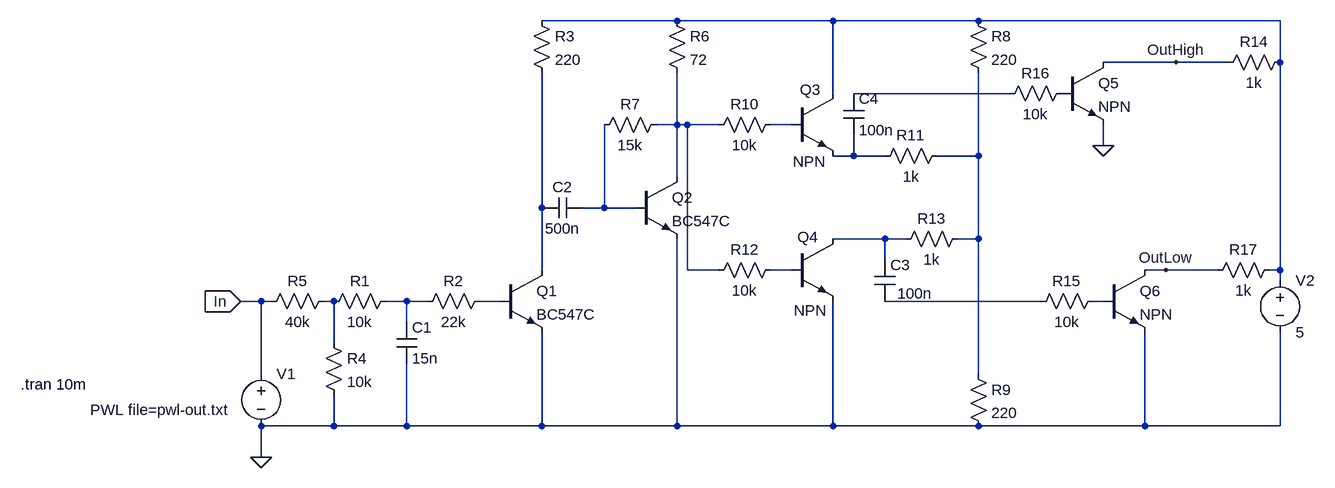
[diagram p0: schematic Filter_incl_Pegelconv_final.asc]
Filter_incl_Pegelconv_final.asc, the LTspice schematic file:
Version 4
SHEET 1 1720 680
WIRE 736 -896 528 -896
WIRE 976 -896 736 -896
WIRE 1200 -896 976 -896
WIRE 1664 -896 1200 -896
WIRE 1504 -832 1392 -832
WIRE 1584 -832 1504 -832
WIRE 1664 -832 1664 -896
WIRE 976 -784 976 -896
WIRE 1248 -784 1008 -784
WIRE 736 -736 736 -816
WIRE 736 -736 704 -736
WIRE 752 -736 736 -736
WIRE 800 -736 752 -736
WIRE 912 -736 880 -736
WIRE 1392 -704 1392 -736
WIRE 1008 -688 1008 -720
WIRE 1008 -688 976 -688
WIRE 1056 -688 1008 -688
WIRE 1200 -688 1200 -816
WIRE 1200 -688 1136 -688
WIRE 736 -656 736 -736
WIRE 528 -608 528 -816
WIRE 624 -608 624 -736
WIRE 624 -608 592 -608
WIRE 672 -608 624 -608
WIRE 1056 -560 976 -560
WIRE 1088 -560 1056 -560
WIRE 1200 -560 1200 -688
WIRE 1200 -560 1168 -560
WIRE 1056 -528 1056 -560
WIRE 528 -512 528 -608
WIRE 752 -512 752 -736
WIRE 800 -512 752 -512
WIRE 912 -512 880 -512
WIRE 1488 -512 1456 -512
WIRE 1568 -512 1488 -512
WIRE 1664 -512 1664 -832
WIRE 1664 -512 1648 -512
WIRE 1664 -496 1664 -512
WIRE 96 -464 64 -464
WIRE 112 -464 96 -464
WIRE 208 -464 192 -464
WIRE 320 -464 288 -464
WIRE 352 -464 320 -464
WIRE 464 -464 432 -464
WIRE 1296 -464 1056 -464
WIRE 1392 -464 1376 -464
WIRE 320 -432 320 -464
WIRE 208 -400 208 -464
WIRE 96 -352 96 -464
WIRE 1200 -352 1200 -560
WIRE 208 -272 208 -320
WIRE 208 -272 96 -272
WIRE 320 -272 320 -368
WIRE 320 -272 208 -272
WIRE 528 -272 528 -416
WIRE 528 -272 320 -272
WIRE 736 -272 736 -560
WIRE 736 -272 528 -272
WIRE 976 -272 976 -464
WIRE 976 -272 736 -272
WIRE 1200 -272 976 -272
WIRE 1456 -272 1456 -416
WIRE 1456 -272 1200 -272
WIRE 1664 -272 1664 -416
WIRE 1664 -272 1456 -272
WIRE 96 -224 96 -272
FLAG 96 -224 0
FLAG 64 -464 In
IOPIN 64 -464 In
FLAG 1488 -512 OutLow
FLAG 1392 -704 0
FLAG 1504 -832 OutHigh
SYMBOL voltage 96 -368 R0
WINDOW 3 -263 71 Left 2
WINDOW 123 24 44 Left 2
WINDOW 39 24 44 Left 2
SYMATTR InstName V1
SYMATTR Value PWL file=pwl-out.txt
SYMBOL res 304 -480 R90
WINDOW 0 0 56 VBottom 2
WINDOW 3 32 56 VTop 2
SYMATTR InstName R1
SYMATTR Value 10k
SYMATTR SpiceLine tol=5
SYMBOL cap 304 -432 R0
SYMATTR InstName C1
SYMATTR Value 15n
SYMATTR SpiceLine V=25 Irms=728m Rser=0.14361 Lser=0
SYMBOL res 448 -480 R90
WINDOW 0 0 56 VBottom 2
WINDOW 3 32 56 VTop 2
SYMATTR InstName R2
SYMATTR Value 22k
SYMBOL voltage 1664 -512 R0
WINDOW 123 0 0 Left 0
WINDOW 39 0 0 Left 0
SYMATTR InstName V2
SYMATTR Value 5
SYMBOL res 512 -912 R0
SYMATTR InstName R3
SYMATTR Value 220
SYMBOL npn 464 -512 R0
SYMATTR InstName Q1
SYMATTR Value BC547C
SYMBOL res 192 -416 R0
SYMATTR InstName R4
SYMATTR Value 10k
SYMBOL res 208 -480 R90
WINDOW 0 0 56 VBottom 2
WINDOW 3 32 56 VTop 2
SYMATTR InstName R5
SYMATTR Value 40k
SYMBOL cap 592 -624 R90
WINDOW 0 0 32 VBottom 2
WINDOW 3 32 32 VTop 2
SYMATTR InstName C2
SYMATTR Value 500n
SYMBOL npn 672 -656 R0
SYMATTR InstName Q2
SYMATTR Value BC547C
SYMBOL res 720 -912 R0
SYMATTR InstName R6
SYMATTR Value 72
SYMBOL res 720 -752 R90
WINDOW 0 0 56 VBottom 2
WINDOW 3 32 56 VTop 2
SYMATTR InstName R7
SYMATTR Value 15k
SYMBOL res 1184 -912 R0
SYMATTR InstName R8
SYMATTR Value 220
SYMBOL res 1184 -368 R0
SYMATTR InstName R9
SYMATTR Value 220
SYMBOL npn 912 -560 R0
WINDOW 0 9 -3 Left 2
WINDOW 3 4 110 Left 2
SYMATTR InstName Q4
SYMBOL res 896 -528 R90
WINDOW 0 0 56 VBottom 2
WINDOW 3 32 56 VTop 2
SYMATTR InstName R12
SYMATTR Value 10k
SYMBOL res 1184 -576 R90
WINDOW 0 0 56 VBottom 2
WINDOW 3 32 56 VTop 2
SYMATTR InstName R13
SYMATTR Value 1k
SYMBOL npn 912 -784 R0
WINDOW 0 13 -6 Left 2
WINDOW 3 2 105 Left 2
SYMATTR InstName Q3
SYMBOL res 896 -752 R90
WINDOW 0 0 56 VBottom 2
WINDOW 3 32 56 VTop 2
SYMATTR InstName R10
SYMATTR Value 10k
SYMBOL npn 1392 -512 R0
SYMATTR InstName Q6
SYMBOL res 1392 -480 R90
WINDOW 0 0 56 VBottom 2
WINDOW 3 32 56 VTop 2
SYMATTR InstName R15
SYMATTR Value 10k
SYMBOL res 1664 -528 R90
WINDOW 0 0 56 VBottom 2
WINDOW 3 32 56 VTop 2
SYMATTR InstName R17
SYMATTR Value 1k
SYMBOL res 1152 -704 R90
WINDOW 0 0 56 VBottom 2
WINDOW 3 32 56 VTop 2
SYMATTR InstName R11
SYMATTR Value 1k
SYMBOL res 1680 -848 R90
WINDOW 0 0 56 VBottom 2
WINDOW 3 32 56 VTop 2
SYMATTR InstName R14
SYMATTR Value 1k
SYMBOL cap 1040 -528 R0
WINDOW 3 35 52 Left 2
SYMATTR InstName C3
SYMATTR Value 100n
SYMBOL cap 992 -784 R0
SYMATTR InstName C4
SYMATTR Value 100n
SYMBOL npn 1328 -832 R0
SYMATTR InstName Q5
SYMBOL res 1344 -800 R90
WINDOW 0 0 56 VBottom 2
WINDOW 3 32 56 VTop 2
SYMATTR InstName R16
SYMATTR Value 10k
TEXT -274 -336 Left 2 !.tran 10m

The netlist it stands for:
* Filter_incl_Pegelconv_final.asc
V1 In 0 PWL file=pwl-out.txt
R1 N012 N011 10k tol=5
C1 N012 0 15n V=25 Irms=728m Rser=0.14361 Lser=0
R2 N013 N012 22k
V2 N001 0 5
R3 N001 N007 220
Q1 N007 N013 0 0 BC547C
R4 N011 0 10k
R5 N011 In 40k
C2 N008 N007 500n
Q2 N003 N008 0 0 BC547C
R6 N001 N003 72
R7 N003 N008 15k
R8 N001 N006 220
R9 N006 0 220
Q4 N009 N010 0 0 NPN
R12 N010 N003 10k
R13 N006 N009 1k
Q3 N001 N004 N005 0 NPN
R10 N004 N003 10k
Q6 OutLow N015 0 0 NPN
R15 N015 N014 10k
R17 N001 OutLow 1k
R11 N006 N005 1k
R14 N001 OutHigh 1k
C3 N009 N014 100n
C4 N002 N005 100n
Q5 OutHigh P001 0 0 NPN
R16 P001 N002 10k
.model NPN NPN
.model PNP PNP
.lib standard.bjt
.tran 10m
.backanno
.end